# Altium schematic sheet POWER.SchDoc
size A4; SheetNumber: 2; SheetTotal: 3
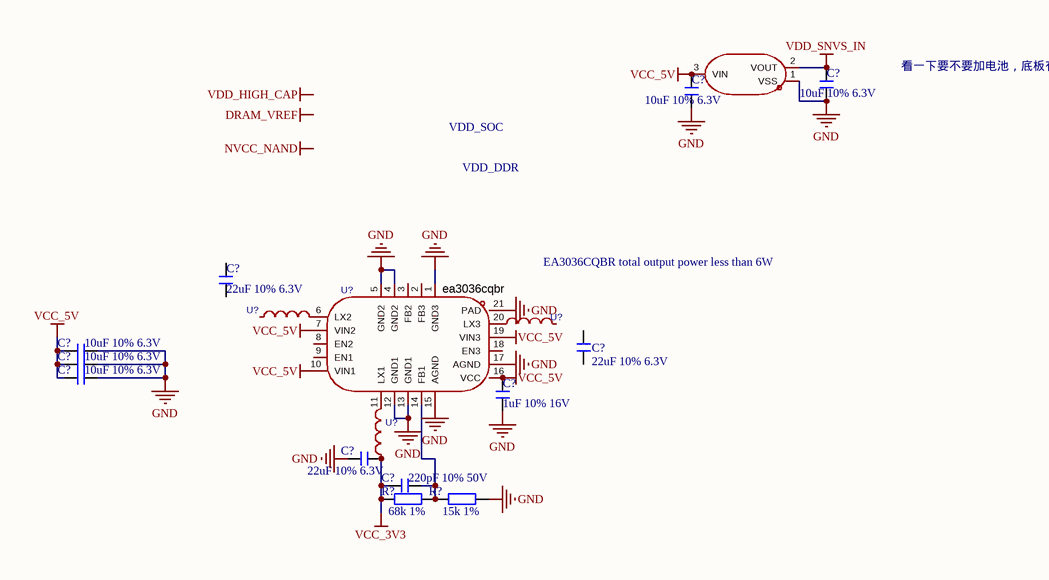
[diagram p0: POWER.SchDoc]

## Parts
(Parts that share a designator on the sheet are numbered #1, #2 ... from top to bottom, then left to right.)
C?#1  10uF 10% 6.3V  [C0402_L]
C?#2  10uF 10% 6.3V  [C0402_L]
C?#3  22uF 10% 6.3V  [C0603_L]
C?#4  22uF 10% 6.3V  [C0603_L]
C?#5  10uF 10% 6.3V  [C0603_L]
C?#6  10uF 10% 6.3V  [C0603_L]
C?#7  10uF 10% 6.3V  [C0603_L]
C?#8  1uF 10% 16V  [C0603_L]
C?#9  22uF 10% 6.3V  [C0603_L]
C?#10  220pF 10% 50V  [C0603_L]
R?#1  68k 1%  [R0603_L]
R?#2  15k 1%  [R0603_L]
U?#1  662k.  [SOT-23-3_L2.9-W1.3-P1.90-LS2.4-BR]  (value not drawn)
U?#2  mwtc252010s2r2mt  [IND-SMD_L2.5-W2.0_AHP252010X]  (value not drawn)
U?#3  mwtc252010s2r2mt  [IND-SMD_L2.5-W2.0_AHP252010X]  (value not drawn)
U?#4  ea3036cqbr  [WQFN-20_L3.0-W3.0-P0.40-BL-EP]
U?#5  mwtc252010s2r2mt  [IND-SMD_L2.5-W2.0_AHP252010X]  (value not drawn)

## Nets
GND: C?#1.1 C?#2.1 C?#5.1 C?#6.1 C?#7.1 C?#8.1 C?#9.1 R?#2.1 U?#1.1(VSS) U?#4.1(GND3) U?#4.4(GND2) U?#4.5(GND2) U?#4.12(GND1) U?#4.13(GND1) U?#4.15(AGND) U?#4.17(AGND) U?#4.21(PAD)
VCC_3V3: C?#9.2 C?#10.1 R?#1.2 U?#5.1
VCC_5V: C?#2.2 C?#5.2 C?#6.2 C?#7.2 C?#8.2 U?#1.3(VIN) U?#4.7(VIN2) U?#4.10(VIN1) U?#4.16(VCC) U?#4.19(VIN3)
VDD_SNVS_IN: C?#1.2 U?#1.2(VOUT)
NetC?#10_2: C?#10.2 R?#1.1 R?#2.2 U?#4.14(FB1)
NetU?#2_2: U?#2.2 U?#4.6(LX2)
NetU?#3_1: U?#3.1 U?#4.20(LX3)
NetU?#4_11: U?#4.11(LX1) U?#5.2

Not connected (* = marked no-connect by the designer): C?#3 1 2; C?#4 1 2; U?#2 1; U?#3 2; U?#4 2(FB3) 3(FB2) 8(EN2) 9(EN1) 18(EN3)

## Notes on the sheet
- 看一下要不要加电池，底板有咩有时钟芯片
- VDD_SOC
- VDD_DDR
- EA3036CQBR total output power less than 6W
- Labels drawn without touching a wire or pin: DRAM_VREF, NVCC_NAND, VDD_HIGH_CAP

## Library data of the parts
C?#1-C?#10 = C: 贴片电容; BOM名称: 无极性贴片电容; 优秀评价可免费更新: 联系淘宝ID：黄晶宝石，获取更新版封装库; 卖家免费技术支持，联系售后: 唯一出售店铺网址https://shop463601444.taobao.com; 本封装库来自淘宝卖家 ID：黄晶宝石: 其他店铺购入均为盗版，请立即申请退款
R?#1 R?#2 = R: 贴片电阻; 优秀评价可免费更新: 联系淘宝ID：黄晶宝石，获取更新版封装库; 卖家免费技术支持，联系售后: 唯一出售店铺网址https://shop463601444.taobao.com; 本封装库来自淘宝卖家 ID：黄晶宝石: 其他店铺购入均为盗版，请立即申请退款; BOM名称: 贴片电阻
U?#1 = 662k.: 输出极性:正极;工作电压:6V;输出电压:3.3V;输出电流:300mA;电源纹波抑制比(PSRR):-;输出类型:固定;; Manufacturer: FM(富满); AddInBom: yes; ModelId: c62791f0466c4ae2a892c056b845b0ca; ModelName: SOT-23-3P_L2.9-W1.3-H1.0-LS2.4-P0.95; ModelTransform: 98.425,114.173,0,180,0,0,0.0005,-0.0005,0; Output Configuration: 正极; Voltage - Supply: 6V; Output Voltage: 3.3V; Output Current: 300mA; Voltage Dropout: 40mV@(30mA); standby current: 10uA; Output Type: 固定; Number of Outputs: 1; Symbol: 662K.; LCSC Part Name: 3.3V 300mA 6V; SupplierPart: C841298; ManufacturerPart: 662K.; Supplier Footprint: SOT-23-3; JLCPCB Part Class: Extended Part; Datasheet: https://item.szlcsc.com/datasheet/662K./898173.html; Supplier: LCSC; ConvertToPcb: yes; FootprintName: SOT-23-3_L2.9-W1.3-P1.90-LS2.4-BR; Power Supply Rejection Ratio (PSRR): -; Noise: -; Features: 短路保护; Operating Temperature: -40℃~+130℃@(Tj)
U?#2 U?#3 U?#5 = mwtc252010s2r2mt: 特性：铁合金材料,高通流,低损耗。黑胶热喷,表面致密性更好。闭合磁路设计,漏磁干扰小。应用：智能手机、平板。笔记本电脑、虚拟现实、增强现实; Manufacturer: Sunlord(顺络); AddInBom: yes; ModelId: 367fe49331814287ace6cad199df558f; ModelName: IND-SMD_L2.5-W2.0-H1.2_AHP252010X; ModelTransform: 78.74,98.425,0,90,0,0,0,0,0; Symbol: MWTC252010S2R2MT; LCSC Part Name: 2.2uH ±20%; SupplierPart: C5151938; ManufacturerPart: MWTC252010S2R2MT; Supplier Footprint: 1008; JLCPCB Part Class: Extended Part; Datasheet: https://item.szlcsc.com/datasheet/MWTC252010S2R2MT/5778351.html; Supplier: LCSC; ConvertToPcb: yes; FootprintName: IND-SMD_L2.5-W2.0_AHP252010X
U?#4 = ea3036cqbr: EA3036C是一款适用于单节锂离子电池或5V直流适配器供电应用的3通道电源管理IC。集成了三个同步降压转换器，可在轻载和重载运行时提供高效率输出。其内部补偿架构简化了应用电路设计。此外，独立的使能控使设计人员能够最大程度地灵活优化电源排序的时序。EA3036C采用20引脚3x3 QFN封装。; Manufacturer: everanalog(申风); AddInBom: yes; ModelId: 9d0d463ce51e4a5d8b410cb10c323c6d; ModelName: WQFN-20_L3.0-W3.0-H0.8-P0.40; ModelTransform: 118.8974,118.8974,0,0,0,0,0,0.005,0; Input Voltage: 2.7V~5.5V; Output Voltage: 0.6V；5.5V; Output Current: 1.2A；1.5A；1.2A; Symbol: EA3036C; LCSC Part Name: 三路电源管理IC; SupplierPart: C570857; ManufacturerPart: EA3036CQBR; Supplier Footprint: WQFN-20-EP(3x3); JLCPCB Part Class: Extended Part; Datasheet: https://item.szlcsc.com/datasheet/EA3036CQBR/596623.html; Supplier: LCSC; ConvertToPcb: yes; FootprintName: WQFN-20_L3.0-W3.0-P0.40-BL-EP; Features: 上电时序控制；逐波限流；轻载高效模式; Interface: -; Operating Temperature: -40℃~+125℃